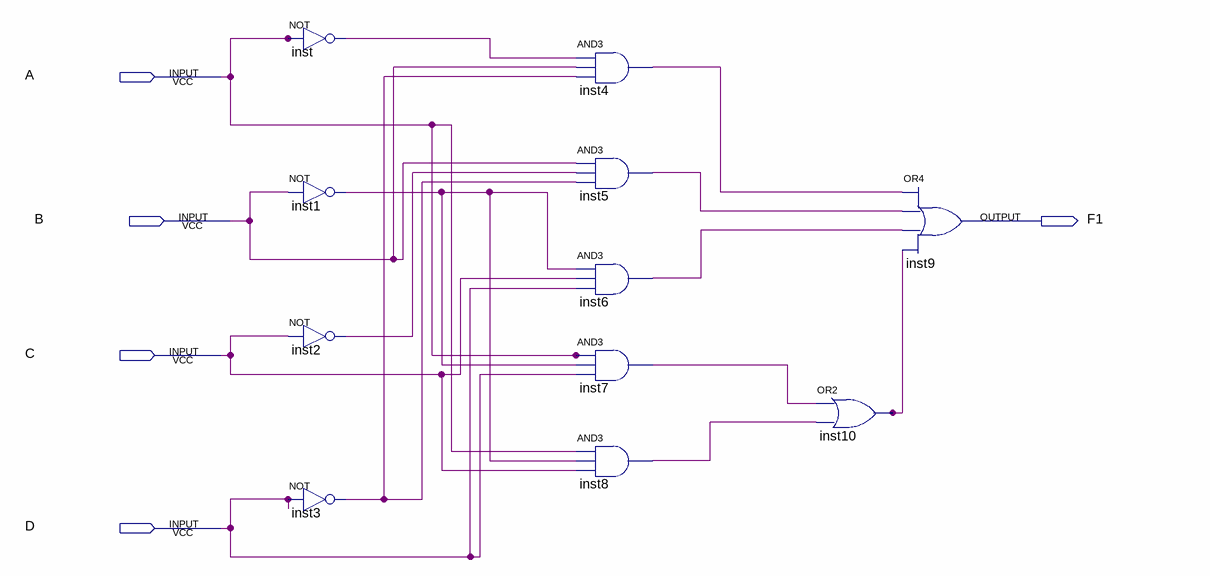
[diagram p0: schematic sheet]
// Quartus schematic lab2.bdf as structural Verilog: 11 symbols, 5 pins
module lab2 (
  input  A,
  input  B,
  input  C,
  input  D,
  output F1
);

  wire inst1_out, inst2_out, inst3_out, inst4_out, inst5_out, inst6_out, inst7_out, inst8_out, inst10_out,
       inst_out;

  not inst (inst_out, A);
  not inst1 (inst1_out, B);
  not inst2 (inst2_out, C);
  not inst3 (inst3_out, D);
  and inst4 (inst4_out, inst_out, B, inst3_out);
  and inst5 (inst5_out, B, inst2_out, inst3_out);
  and inst6 (inst6_out, inst1_out, C, D);
  and inst7 (inst7_out, A, inst1_out, D);
  and inst8 (inst8_out, A, inst1_out, C);
  or inst10 (inst10_out, inst7_out, inst8_out);
  or inst9 (F1, inst4_out, inst5_out, inst6_out, inst10_out);
endmodule
